# EasyEDA Pro project ProDoc_P1_2026-10-11.epro

# Schematic Schematic1_1
Assembly Variant: Basic; Board Name: Board1; Create Date: 2026-09-22; Page Name: P1; Project Name: imu_to_servo; Schematic Name: Schematic1; Update Date: 2026-09-22; Company: 嘉立创EDA; Page Size: A4; Version: V1.0
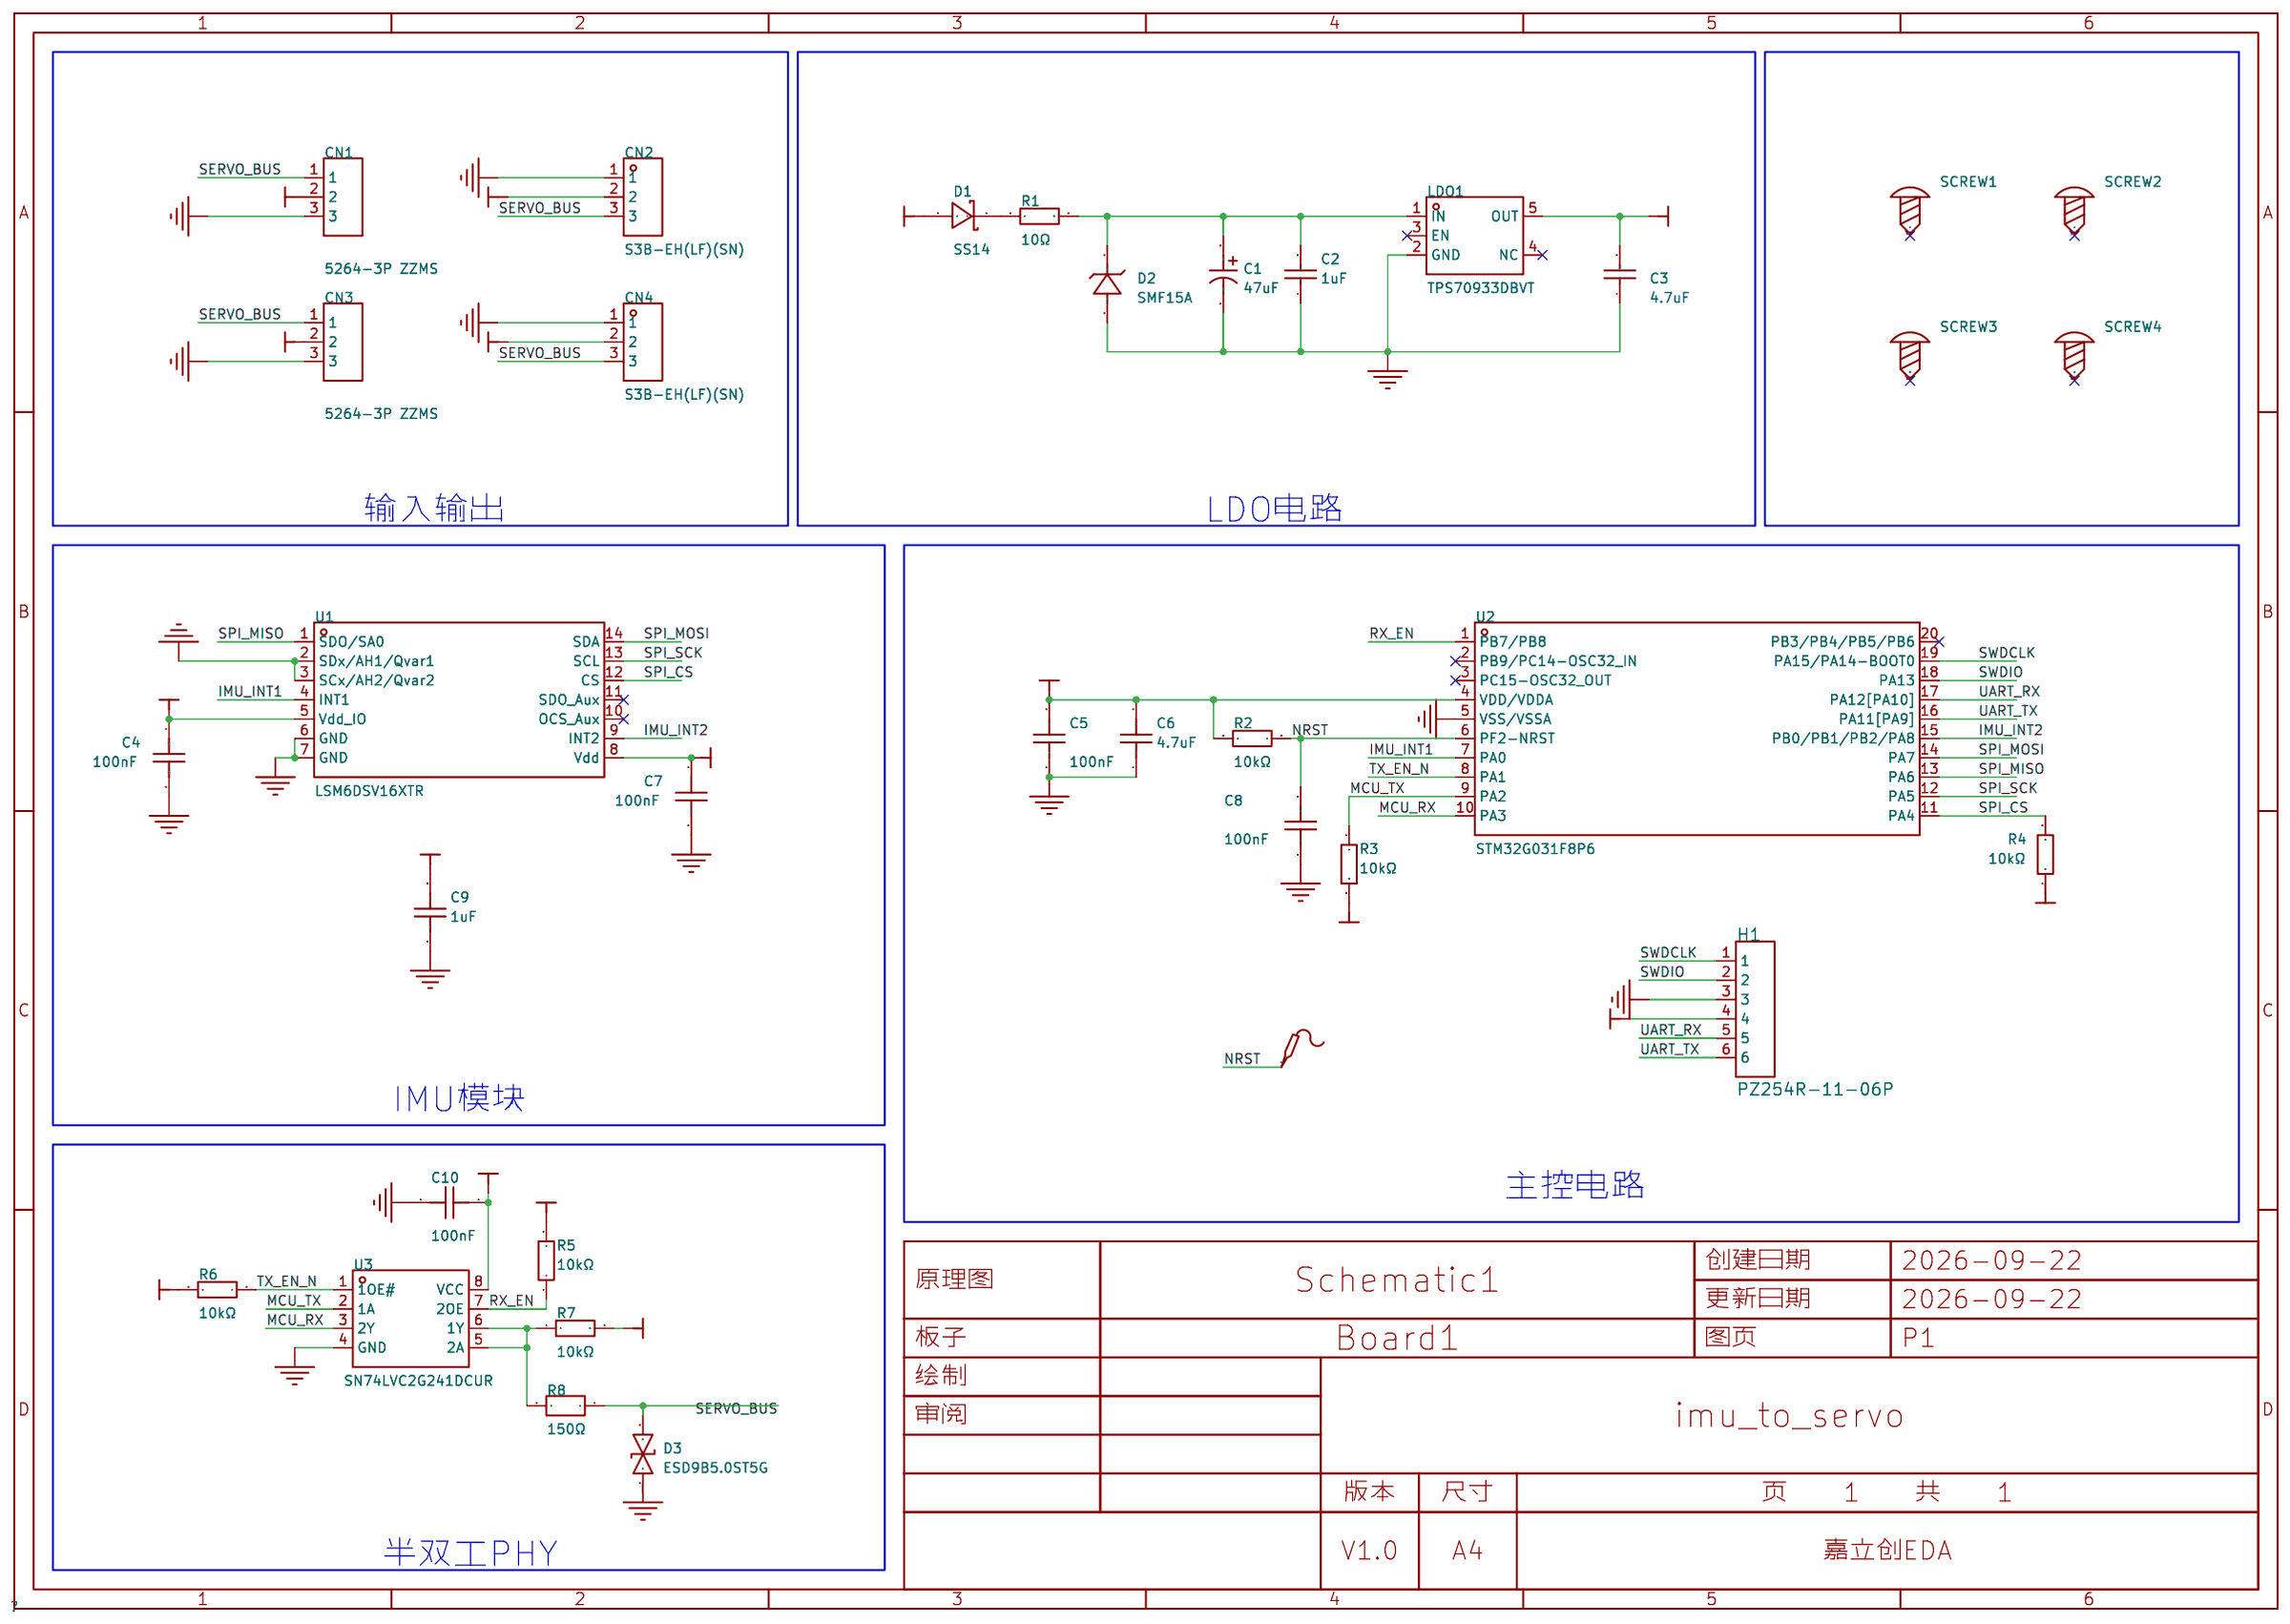
[diagram p0: schematic sheet]

## Parts
C1  47uF  [CAP-SMD_BD6.3-L6.6-W6.6-FD]
C2  1uF  [C0805]
C3  4.7uF  [C0805]
C4  100nF  [C0603]
C5  100nF  [C0603]
C6  4.7uF  [C0805]
C7  100nF  [C0603]
C8  100nF  [C0603]
C9  1uF  [C0603]
C10  100nF  [C0603]
CN1  5264-3P ZZMS  [CONN-TH_5264-3P-ZZMS]
CN2  S3B-EH(LF)(SN)  [CONN-TH_3P-P2.50_S3B-EH-LF-SN]  (no BOM)
CN3  5264-3P ZZMS  [CONN-TH_5264-3P-ZZMS]
CN4  S3B-EH(LF)(SN)  [CONN-TH_3P-P2.50_S3B-EH-LF-SN]  (no BOM)
D1  SS14  [SMA_L4.3-W2.6-LS5.2-RD]
D2  SMF15A  [SOD-123FL_L2.7-W1.8-LS3.8-RD]
D3  ESD9B5.0ST5G  [SOD-923_L0.8-W0.6-LS1.0-BI]
H1  PZ254R-11-06P  [HDR-TH_6P-P2.54-H-M-W10.4]
LDO1  TPS70933DBVT  [SOT-23-5_L2.9-W1.6-P0.95-LS2.8-BR]
NRST1  -  [Test-Point-0.5mm]
R1  10Ω  [R1206]
R2  10kΩ  [R0603]
R3  10kΩ  [R0603]
R4  10kΩ  [R0603]
R5  10kΩ  [R0603]
R6  10kΩ  [R0603]
R7  10kΩ  [R0603]
R8  150Ω  [R0603]
SCREW1  -  [M2螺丝]
SCREW2  -  [M2螺丝]
SCREW3  -  [M2螺丝]
SCREW4  -  [M2螺丝]
U1  LSM6DSV16XTR  [LGA-14_L3.0-W2.5-P0.50-BR]
U2  STM32G031F8P6  [TSSOP-20_L6.5-W4.4-P0.65-LS6.4-BL]
U3  SN74LVC2G241DCUR  [VSSOP-8_L2.3-W2.0-P0.50-LS3.1-BR]

## Library data of the parts
C1 = RVE35V47M6X5: 容值:47uF;精度:±20%;额定电压:35V;纹波电流:140mA@120Hz;等效串联电阻(ESR):850mΩ@100kHz;; LCSC Part Name: 47uF ±20% 35V; Supplier Part: C48970990; Manufacturer: JIERR(捷而瑞); Supplier Footprint: SMD,D6.3xL5.4mm; JLCPCB Part Class: Extended Part; Datasheet: https://item.szlcsc.com/datasheet/RVE35V47M6X5/51296195.html; Supplier: LCSC; Tolerance: ±20%; Voltage Rating: 35V; Ripple Current: 140mA@120Hz; Equivalent Series Resistance(ESR): 850mΩ@100kHz; Diameter: 6.3mm; Height - Seated (Max): 5.4mm; Lifetime: 2000hrs@105℃; Operating Temperature: -40℃~+105℃
C2 = CC0805KKX7R9BB105: 容值:1uF;精度:±10%;额定电压:50V;温度系数:X7R;; LCSC Part Name: 1uF ±10% 50V; Supplier Part: C91185; Manufacturer: YAGEO(国巨); Supplier Footprint: 0805; JLCPCB Part Class: Extended Part; Datasheet: https://item.szlcsc.com/datasheet/CC0805KKX7R9BB105/92374.html; Supplier: LCSC; Tolerance: ±10%; Voltage Rating: 50V; Temperature Coefficient: X7R
C3 = CL21B475KPFNNNE: 容值:4.7uF;精度:±10%;额定电压:10V;温度系数:X7R;; LCSC Part Name: 4.7uF ±10% 10V; Supplier Part: C87998; Manufacturer: SAMSUNG(三星); Supplier Footprint: 0805; JLCPCB Part Class: Extended Part; Datasheet: https://item.szlcsc.com/datasheet/CL21B475KPFNNNE/89176.html; Supplier: LCSC; Tolerance: ±10%; Voltage Rating: 10V; Temperature Coefficient: X7R
C4 C5 C7 C8 C10 = CC0603KRX7R0BB104: 容值:100nF;精度:±10%;额定电压:100V;温度系数:X7R;; LCSC Part Name: 100nF ±10% 100V; Supplier Part: C113803; Manufacturer: YAGEO(国巨); Supplier Footprint: 0603; JLCPCB Part Class: Extended Part; Datasheet: https://item.szlcsc.com/datasheet/CC0603KRX7R0BB104/115039.html; Supplier: LCSC; Tolerance: ±10%; Voltage Rating: 100V; Temperature Coefficient: X7R
C6 = HGC0805R7475K500NSLJ: 容值:4.7uF;精度:±10%;额定电压:50V;温度系数:X7R;; LCSC Part Name: 4.7uF ±10% 50V; Supplier Part: C7472970; Manufacturer: Chinocera(华瓷); Supplier Footprint: 0805; JLCPCB Part Class: Extended Part; Datasheet: https://item.szlcsc.com/datasheet/HGC0805R7475K500NSLJ/8532817.html; Supplier: LCSC; Tolerance: ±10%; Voltage Rating: 50V; Temperature Coefficient: X7R
C9 = 0603B105K500NT: 容值:1uF;精度:±10%;额定电压:50V;温度系数:X7R;; LCSC Part Name: 1uF ±10% 50V; Supplier Part: C90540; Manufacturer: FH(风华); Supplier Footprint: 0603; JLCPCB Part Class: Extended Part; Datasheet: https://item.szlcsc.com/datasheet/0603B105K500NT/91727.html; Supplier: LCSC; Tolerance: ±10%; Voltage Rating: 50V; Temperature Coefficient: X7R
CN1 CN3 = 5264-3P ZZMS: 插针结构:1x3P;间距:2.5mm;安装方式:直插;参考系列:Mini-SPOX(5264);总PIN数:3P;排数:1;每排PIN数:3;行距:-;额定电流:3A;触头材质:黄铜;触头镀层:锡;工作温度:-25℃~+85℃;; LCSC Part Name: 米色 1x3P 间距:2.5mm 直插 系列:Mini-SPOX(5264); Supplier Part: C49023814; Manufacturer: SHOU HAN(首韩); Supplier Footprint: 插件,P=2.5mm; JLCPCB Part Class: Extended Part; Datasheet: https://item.szlcsc.com/datasheet/5264-3P%2520ZZMS/51384189.html; Supplier: LCSC; Pins Structure: 1x3P; Pitch: 2.5mm; Mounting Type: 直插; Reference Series: Mini-SPOX(5264); Number of Pins: 3P; Number of Rows: 1; Number of PINs Per Row: 3; Current Rating: 3A; Contact Material: 黄铜; Contact Plating: 锡; Operating Temperature: -25℃~+85℃; Voltage Rating: 250V; Plastic Material: 玻纤增强PA66; Flame Retardant Rating: UL94V-0; Color: 米色
CN2 CN4 = S3B-EH(LF)(SN): 插针结构:1x3P;间距:2.5mm;安装方式:弯插;参考系列:EH;总PIN数:3P;排数:1;每排PIN数:3;行距:-;额定电流:3A;触头材质:黄铜;触头镀层:锡;工作温度:-25℃~+85℃;; LCSC Part Name: 1x3P 间距:2.5mm 弯插 系列:EH; Supplier Part: C263754; Manufacturer: JST; Supplier Footprint: 弯插,P=2.5mm; JLCPCB Part Class: Extended Part; Datasheet: https://item.szlcsc.com/datasheet/S3B-EH(LF)(SN)/254655.html; Supplier: LCSC; Pins Structure: 1x3P; Pitch: 2.5mm; Mounting Type: 弯插; Reference Series: EH; Number of Pins: 3P; Number of Rows: 1; Number of PINs Per Row: 3; Current Rating: 3A; Contact Material: 黄铜; Contact Plating: 锡; Operating Temperature: -25℃~+85℃; Voltage Rating: 250V; Plastic Material: PA66; Flame Retardant Rating: UL94V-0; Supplementary Features: 打K脚; Color: 白色; Z-Height of the Board: 4.2mm; X-Length of Bottom Edge on Board (Spacing Line): 10mm; Y-Width of Bottom Edge on Board: 8.2mm
D1 = SS14_C83852: 正向压降(Vf):500mV@1A;直流反向耐压(Vr):40V;整流电流:1A;; LCSC Part Name: 电压:40V 电流:1A; Supplier Part: C83852; Manufacturer: onsemi(安森美); Supplier Footprint: SMA(DO-214AC); JLCPCB Part Class: Extended Part; Datasheet: https://item.szlcsc.com/datasheet/SS14/85019.html; Supplier: LCSC; Voltage - Forward(Vf@If): 500mV@1A; Voltage - DC Reverse(Vr): 40V; Current - Rectified: 1A; Reverse Leakage Current (Ir): 200uA@40V; Operating Junction Temperature Range: -65℃~+125℃; Non-Repetitive Peak Forward Surge Current: 40A
D2 = SMF15A_C19077509: 极性:单向;反向截止电压(Vrwm):15V;钳位电压:24.4V;峰值脉冲电流(Ipp):8.2A@10/1000us;峰值脉冲功率(Ppp):200W@10/1000us;击穿电压(VBR):18.5V;; LCSC Part Name: 单向TVS 15V截止 峰值浪涌电流：8.2A@10/1000us; Supplier Part: C19077509; Manufacturer: R+O(宏嘉诚); Supplier Footprint: SOD-123FL; JLCPCB Part Class: Extended Part; Datasheet: https://item.szlcsc.com/datasheet/SMF15A/20275594.html; Supplier: LCSC; Polarity: 单向; Reverse Stand-Off Voltage (Vrwm): 15V; Clamping Voltage: 24.4V; Peak Pulse Current (Ipp): 8.2A@10/1000us; Peak Pulse Power Dissipation (Ppp): 200W@10/1000us; Voltage - Breakdown: 18.5V; Reverse Leakage Current (Ir): 1uA; Number of Channels: 单路; Operating Temperature: -55℃~+150℃; level of protection: IEC 61000-4-2; Type: TVS
D3 = ESD9B5.0ST5G: 极性:双向;反向截止电压(Vrwm):5V;钳位电压:15V;峰值脉冲功率(Ppp):-;击穿电压(VBR):7.8V;; LCSC Part Name: 双向TVS 5V截止; Supplier Part: C111566; Manufacturer: onsemi(安森美); Supplier Footprint: SOD-923; JLCPCB Part Class: Extended Part; Datasheet: https://item.szlcsc.com/datasheet/ESD9B5.0ST5G/112793.html; Supplier: LCSC; Polarity: 双向; Reverse Stand-Off Voltage (Vrwm): 5V; Clamping Voltage: 15V; Voltage - Breakdown: 7.8V; Reverse Leakage Current (Ir): 100nA; Number of Channels: 单路; Operating Temperature: -55℃~+150℃; level of protection: IEC 61000-4-2; Type: TVS; Junction Capacitance: 15pF
H1 = PZ254R-11-06P: 插针结构:1x6P;间距:2.54mm;行距:-;圆针/方针:方针;安装方式:弯插;排数:单排;总PIN位数:6P;额定电流:3A;额定电压:250V;配合针长度:6mm;塑高:2.5mm;端接针长度:-;触头材质:黄铜;触头镀层:-;工作温度:-40℃~+105℃;颜色:黑色;; LCSC Part Name: 1x6P 间距:2.54mm 方针 弯插; Supplier Part: C492414; Manufacturer: XFCN(兴飞); Supplier Footprint: 弯插,P=2.54mm; JLCPCB Part Class: Extended Part; Datasheet: https://item.szlcsc.com/datasheet/PZ254R-11-06P/502970.html; Supplier: LCSC; Pin Structure: 1x6P; Pitch: 2.54mm; Circluar Pins/Square Pins: 方针; Mounting Type: 弯插; Number of Rows: 单排; Number of Pins: 6P; Current Rating: 3A; Voltage Rating (Max): 250V; Length of Mating Pin: 6mm; Insulation Height: 2.5mm; Contact Material: 黄铜; Operating Temperature: -40℃~+105℃; Color: 黑色
LDO1 = TPS70933DBVT: 输出极性:正极;工作电压:30V;输出电压:3.3V;输出电流:150mA;电源纹波抑制比(PSRR):52dB@(1kHz);输出类型:固定;; LCSC Part Name: 3.3V 150mA 30V; Supplier Part: C2861984; Manufacturer: TI(德州仪器); Supplier Footprint: SOT-23-5; JLCPCB Part Class: Extended Part; Datasheet: https://www.ti.com/cn/lit/ds/symlink/tps709.pdf; Supplier: LCSC; Output Configuration: 正极; Voltage - Supply: 30V; Output Voltage: 3.3V; Output Current: 150mA; Power Supply Rejection Ratio (PSRR): 52dB@(1kHz); Voltage Dropout: 650mV@(150mA); standby current: 1.3uA; Noise: 190uVrms; Features: 热关断；反极性电流保护；使能控制；过流保护；输入欠压保护; Operating Temperature: -40℃~+125℃@(Tj); Output Type: 固定; Number of Outputs: 1
NRST1 = Test-Point: Test Point 测试点
R1 = RC1206FR-0710RL: 电阻类型:厚膜电阻;阻值:10Ω;精度:±1%;功率:250mW;最大工作电压:200V;温度系数:±200ppm/℃;; LCSC Part Name: 厚膜电阻 10Ω ±1% 250mW; Supplier Part: C108080; Manufacturer: YAGEO(国巨); Supplier Footprint: 1206; JLCPCB Part Class: Extended Part; Datasheet: https://atta.szlcsc.com/upload/public/pdf/source/20180821/C275644_0D56F95EFF785E7D9A1FEF436B37DA78.pdf; Supplier: LCSC; Type: 厚膜电阻; Tolerance: ±1%; Power(Watts): 250mW; Overload Voltage (Max): 200V; Temperature Coefficient: ±200ppm/℃; Operating Temperature Range: -55℃~+155℃
R2-R7 = RT0603BRD0710KL: 电阻类型:薄膜电阻;阻值:10kΩ;精度:±0.1%;功率:100mW;工作电压:75V;温度系数:±25ppm/℃;; LCSC Part Name: 薄膜电阻 10kΩ ±0.1% 100mW; Supplier Part: C95204; Manufacturer: YAGEO(国巨); Supplier Footprint: 0603; JLCPCB Part Class: Extended Part; Datasheet: https://item.szlcsc.com/datasheet/RT0603BRD0710KL/96405.html; Supplier: LCSC; Type: 薄膜电阻; Tolerance: ±0.1%; Power(Watts): 100mW; Voltage-Supply(Max): 75V; Temperature Coefficient: ±25ppm/℃; Operating Temperature: -55℃~+155℃
R8 = FRC0603F1500TS: 电阻类型:厚膜电阻;阻值:150Ω;精度:±1%;功率:100mW;工作电压:75V;温度系数:±100ppm/℃;; LCSC Part Name: 150Ω ±1% 100mW 厚膜电阻; Supplier Part: C2906994; Manufacturer: FOJAN(富捷); Supplier Footprint: 0603; JLCPCB Part Class: Extended Part; Supplier: LCSC; Type: 厚膜电阻; Tolerance: ±1%; Power(Watts): 100mW; Voltage-Supply(Max): 75V; Temperature Coefficient: ±100ppm/℃; Operating Temperature: -55℃~+155℃
SCREW1-SCREW4 = M2螺丝: Supplier Footprint: 插件
U1 = LSM6DSV16XTR: 传感器类型:IMU(加速度计+陀螺仪);接口类型:I2C；SPI;; LCSC Part Name: 适用于高端应用的六轴惯性测量单元（IMU）和具备嵌入式传感器融合功能的Al传感器、Qvar; Supplier Part: C5267406; Manufacturer: ST(意法半导体); Supplier Footprint: LGA-14(2.5x3); JLCPCB Part Class: Extended Part; Datasheet: https://item.szlcsc.com/datasheet/LSM6DSV16XTR/5993815.html; Supplier: LCSC; Accelerometer Sensing Axis: X,Y,Z; Acceleration Measurement Range (MAX): ±16g; Gyroscope Sensing Axis: X,Y,Z; Gyroscope Measurement Range (MAX): ±4000dps; Sensor Type: IMU(加速度计+陀螺仪); Interface: I2C；SPI; Voltage - Supply: 1.71V~3.6V; Cache Size: 4.5KB; Standby Current: 2.6uA; Operating Temperature: -40℃~+85℃; Features: 运动事件检测；同步与时间戳
U2 = STM32G031F8P6: CPU内核:ARM Cortex-M0+;CPU最大主频:64MHz;CPU位数:32 Bit;; LCSC Part Name: 主流Arm Cortex-M0+ MCU，具有64 KB Flash存储器、8 KB RAM、64 MHz CPU、2x USART、定时器、ADC和通信接口，1.7-3.6V; Supplier Part: C529334; Manufacturer: ST(意法半导体); Supplier Footprint: TSSOP-20; JLCPCB Part Class: Extended Part; Datasheet: https://item.szlcsc.com/datasheet/STM32G031F8P6/549612.html; Supplier: LCSC; CPU Core: ARM Cortex-M0+; CPU Maximum Speed: 64MHz; Core Size: 32 Bit; Program Storage Size: 64KB; Program Memory Type: FLASH; RAM Size: 8KB; Number of I/O: 18; ADC (Bit): 12bit; Oscillator Type: 内置+外置; Voltage - Supply: 1.7V~3.6V; Operating Temperature: -40℃~+85℃
U3 = SN74LVC2G241DCUR: 输入类型:-;工作电压:1.65V~5.5V;元件数:2;每个元件位数:1;灌电流(IOL):32mA;拉电流(IOH):32mA;; LCSC Part Name: 三态输出，双路缓冲器/驱动器; Supplier Part: C10430; Manufacturer: TI(德州仪器); Supplier Footprint: VSSOP-8; JLCPCB Part Class: Extended Part; Datasheet: https://www.ti.com/cn/lit/ds/symlink/sn74lvc2g241.pdf; Supplier: LCSC; output type: 三态; Voltage - Supply: 1.65V~5.5V; Number of Elements: 2; Number of Bits per Element: 1; Channel Type: 单向; Current - Output Low(IOL): 32mA; Current - Output High(IOH): 32mA; Logic Family: 74LVC; Operating Temperature: -40℃~+85℃; Quiescent Current: 10uA; Propagation Delay: 4.1ns@3.3V,50pF; Features: 掉电隔离；输出使能

## Nets
+3.3V: C3.2 C4.1 C5.2 C6.2 C7.1 C9.2 C10.1 H1.4 LDO1.5(OUT) R2.2 R3.2 R4.1 R5.2 R6.2 R7.2 U1.5(Vdd_IO) U1.8(Vdd) U2.4(VDD/VDDA) U3.8(VCC)
GND: C1.2 C2.1 C3.1 C4.2 C5.1 C6.1 C7.2 C8.1 C9.1 C10.2 CN1.3 CN2.1 CN3.3 CN4.1 D2.2(A) D3.1 H1.3 LDO1.2(GND) U1.2(SDx/AH1/Qvar1) U1.3(SCx/AH2/Qvar2) U1.6(GND) U1.7(GND) U2.5(VSS/VSSA) U3.4(GND)
VDD_BUS: CN1.2 CN2.2 CN3.2 CN4.2 D1.2(A)
IMU_INT1: U1.4(INT1) U2.7(PA0)
IMU_INT2: U1.9(INT2) U2.15(PB0/PB1/PB2/PA8)
MCU_RX: U2.10(PA3) U3.3(2Y)
MCU_TX: R3.1 U2.9(PA2) U3.2(1A)
NRST: C8.2 NRST1.1 R2.1 U2.6(PF2-NRST)
RX_EN: R5.1 U2.1(PB7/PB8) U3.7(2OE)
SERVO_BUS: CN1.1 CN2.3 CN3.1 CN4.3 D3.2 R8.1
SPI_CS: R4.2 U1.12(CS) U2.11(PA4)
SPI_MISO: U1.1(SDO/SA0) U2.13(PA6)
SPI_MOSI: U1.14(SDA) U2.14(PA7)
SPI_SCK: U1.13(SCL) U2.12(PA5)
SWDCLK: H1.1 U2.19(PA15/PA14-BOOT0)
SWDIO: H1.2 U2.18(PA13)
TX_EN_N: R6.1 U2.8(PA1) U3.1(1OE#)
UART_RX: H1.5 U2.17(PA12[PA10])
UART_TX: H1.6 U2.16(PA11[PA9])
Net-(C1-1): C1.1 C2.2 D2.1(K) LDO1.1(IN) R1.2
Net-(D1-1): D1.1(K) R1.1
Net-(R7-1): R7.1 R8.2 U3.5(2A) U3.6(1Y)

Not connected (* = marked no-connect by the designer): LDO1 3(EN)* 4(NC)*; SCREW1 1*; SCREW2 1*; SCREW3 1*; SCREW4 1*; U1 10(OCS_Aux)* 11(SDO_Aux)*; U2 2(PB9/PC14-OSC32_IN)* 3(PC15-OSC32_OUT)* 20(PB3/PB4/PB5/PB6)*

## Notes on the sheet
- 输入输出
- LDO电路
- IMU模块
- 主控电路
- 半双工PHY
